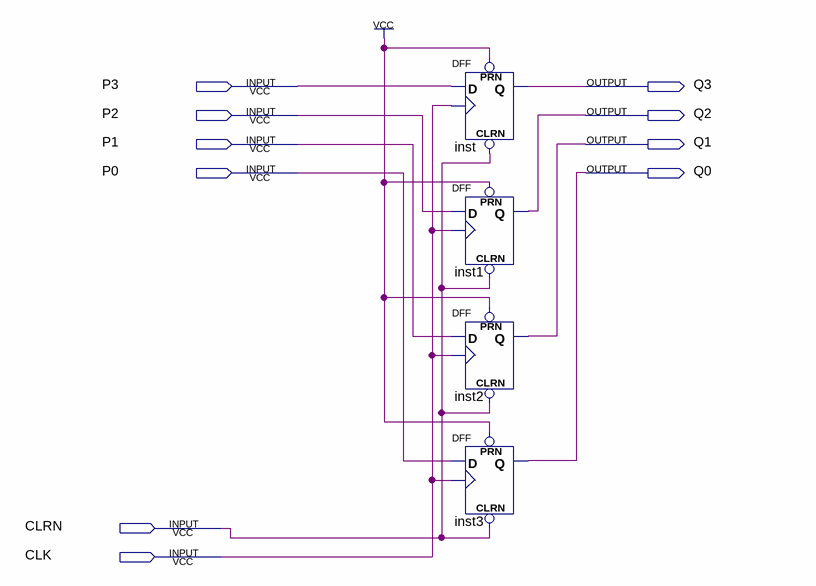
[diagram p0: schematic sheet]
// Quartus schematic 4bitRegister.bdf as structural Verilog: 4 symbols, 10 pins
module \4bitRegister  (
  input  P3,
  input  P2,
  input  P1,
  input  P0,
  input  CLRN,
  input  CLK,
  output Q3,
  output Q2,
  output Q1,
  output Q0
);

  DFF inst (.CLRN(CLRN), .CLK(CLK), .D(P3), .PRN(1'b1), .Q(Q3));
  DFF inst1 (.CLRN(CLRN), .CLK(CLK), .D(P2), .PRN(1'b1), .Q(Q2));
  DFF inst2 (.CLRN(CLRN), .CLK(CLK), .D(P1), .PRN(1'b1), .Q(Q1));
  DFF inst3 (.CLRN(CLRN), .CLK(CLK), .D(P0), .PRN(1'b1), .Q(Q0));
endmodule
